# Altium project WIFI_BoardV4.00.PrjPcb (part 1 of 3)
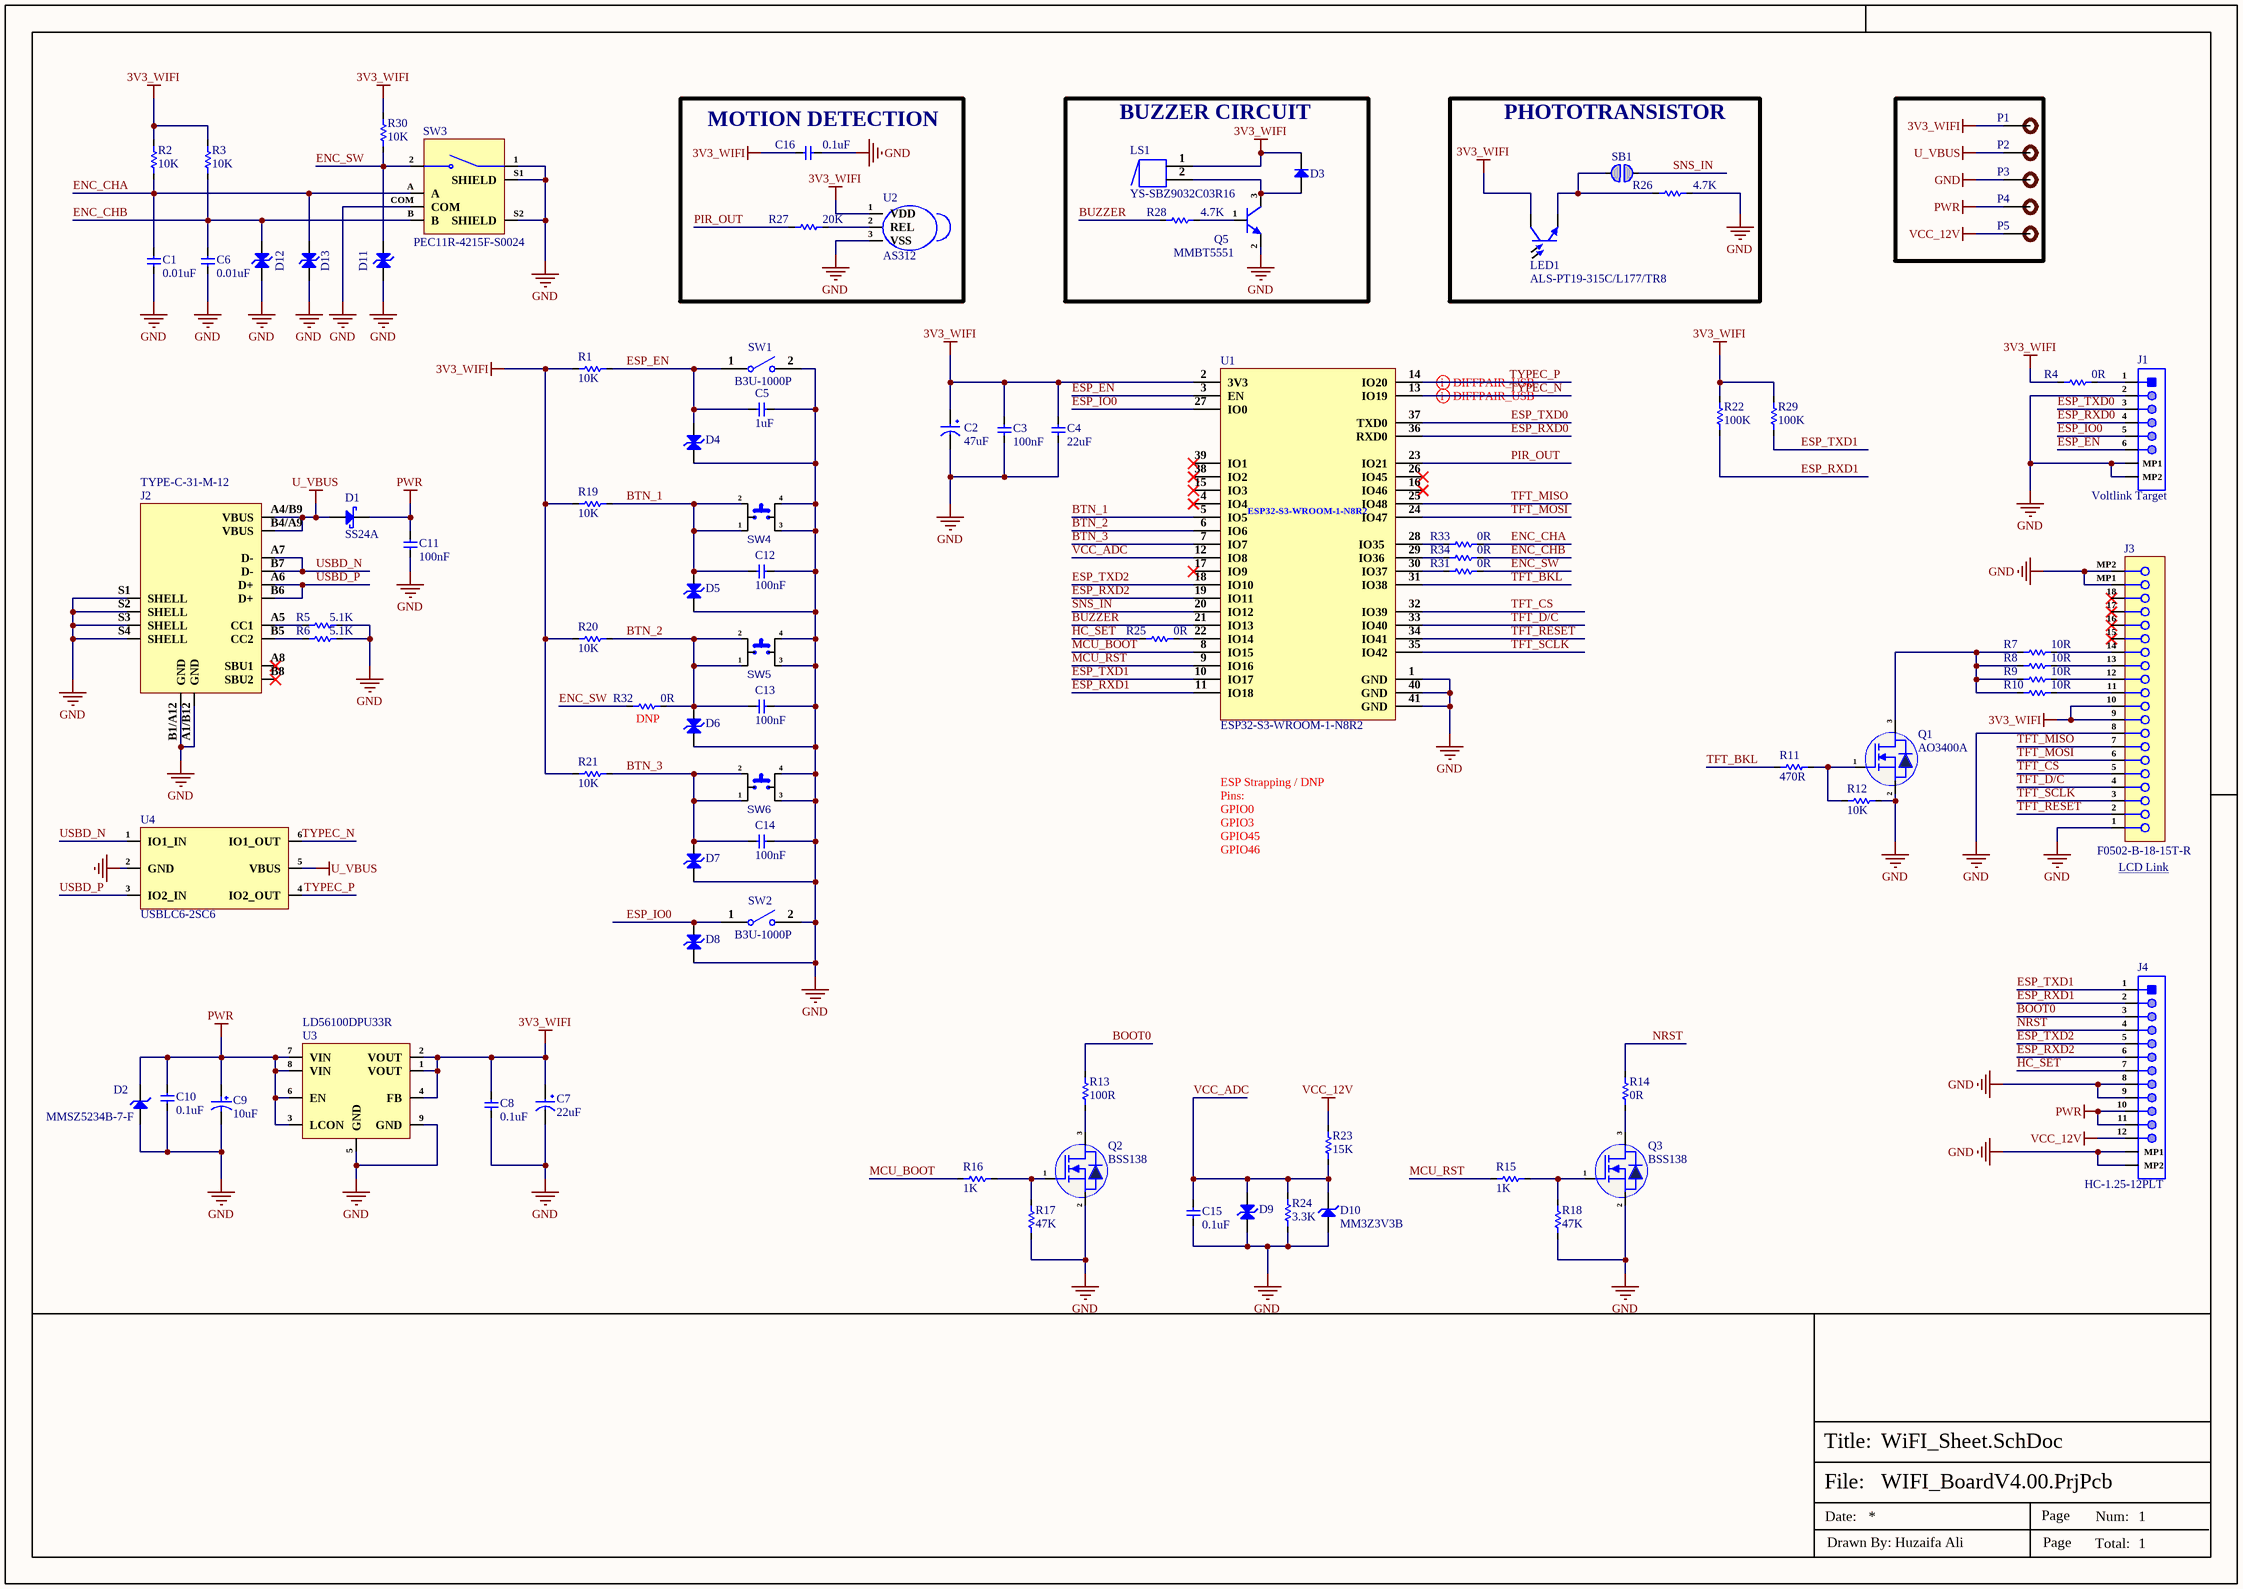
[diagram p0: WiFI_Sheet.SchDoc]
1 sheet, 89 parts. Net scope: global (net labels, ports and power ports of the same name join across sheets).
Board file: WIFI_BoardV4.00.PcbDoc

## Sheet WiFI_Sheet.SchDoc
size 420 x 297 mm; SheetNumber: 1; SheetTotal: 1

### Parts
C1  0.01uF  [Cap-0402]
C2  47uF  [Case-D]
C3  100nF  [Cap-0402]
C4  22uF  [Cap-0603]
C5  1uF  [Cap-0402]
C6  0.01uF  [Cap-0402]
C7  22uF  [Tant-0805]
C8  0.1uF  [Cap-0402]
C9  10uF  [Case-A]
C10  0.1uF  [Cap-0402]
C11  100nF  [Cap-0603]
C12  100nF  [Cap-0402]
C13  100nF  [Cap-0402]
C14  100nF  [Cap-0402]
C15  0.1uF  [Cap-0402]
C16  0.1uF  [Cap-0603]
D1  SS24A  [SMA]
D2  MMSZ5234B-7-F  [SOD-123]
D3  1N4148W-7-F  [SOD-123]  (value not drawn)
D4  LESD8D3.3CAT5G  [SOD-882 Bi Directional]  (value not drawn)
D5  LESD8D3.3CAT5G  [SOD-882 Bi Directional]  (value not drawn)
D6  LESD8D3.3CAT5G  [SOD-882 Bi Directional]  (value not drawn)
D7  LESD8D3.3CAT5G  [SOD-882 Bi Directional]  (value not drawn)
D8  LESD8D3.3CAT5G  [SOD-882 Bi Directional]  (value not drawn)
D9  LESD8D3.3CAT5G  [SOD-882 Bi Directional]  (value not drawn)
D10  MM3Z3V3B  [SOD323F]
D11  LESD8D3.3CAT5G  [SOD-882 Bi Directional]  (value not drawn)
D12  LESD8D3.3CAT5G  [SOD-882 Bi Directional]  (value not drawn)
D13  LESD8D3.3CAT5G  [SOD-882 Bi Directional]  (value not drawn)
J1  Voltlink Target  [Voltlink Target]
J2  TYPE-C-31-M-12  [TYPE-C-31-M-12_]
J3  F0502-B-18-15T-R  [F0502-B-18-15T-R]
J4  HC-1.25-12PLT  [HC-1.25-12PLT]
LED1  ALS-PT19-315C/L177/TR8  [ALS-PT19-315C/L177/TR_]
LS1  YS-SBZ9032C03R16  [YS-SBZ9032C03R16_]
P1  TEST POINT 0.5mm Dia  [Test-point - 0.5mm]  (value not drawn)
P2  TEST POINT 0.5mm Dia  [Test-point - 0.5mm]  (value not drawn)
P3  TEST POINT 0.5mm Dia  [Test-point - 0.5mm]  (value not drawn)
P4  TEST POINT 0.5mm Dia  [Test-point - 0.5mm]  (value not drawn)
P5  TEST POINT 0.5mm Dia  [Test-point - 0.5mm]  (value not drawn)
Q1  AO3400A  [sot-23]
Q2  BSS138  [Sot-23]
Q3  BSS138  [Sot-23]
Q5  MMBT5551  [SOT-23]
R1  10K  [Res-0402]
R2  10K  [Res-0603]
R3  10K  [Res-0603]
R4  0R  [Res-0603]
R5  5.1K  [Res-0603]
R6  5.1K  [Res-0603]
R7  10R  [Res-0402]
R8  10R  [Res-0402]
R9  10R  [Res-0402]
R10  10R  [Res-0402]
R11  470R  [Res-0603]
R12  10K  [Res-0603]
R13  100R  [Res-0402]
R14  0R  [Res-0402]
R15  1K  [Res-0402]
R16  1K  [Res-0402]
R17  47K  [Res-0402]
R18  47K  [Res-0402]
R19  10K  [Res-0402]
R20  10K  [Res-0402]
R21  10K  [Res-0402]
R22  100K  [Res-0603]
R23  15K  [Res-0603]
R24  3.3K  [Res-0603]
R25  0R  [Res-0603]
R26  4.7K  [Res-0603]
R27  20K  [Res-0603]
R28  4.7K  [Res-0603]
R29  100K  [Res-0603]
R30  10K  [Res-0603]
R31  0R  [Res-0603]
R32  DNP  [Res-0603]
R33  0R  [Res-0603]
R34  0R  [Res-0603]
SB1  Solder Bridge 0603  [Solder Bridge]  (value not drawn)  (no BOM)
SW1  B3U-1000P  [B3U-1000P]
SW2  B3U-1000P  [B3U-1000P]
SW3  PEC11R-4215F-S0024  [PEC11R-4215F-S0024]
SW4  TL3300CF160Q  [TL3300CF160Q.]  (value not drawn)
SW5  TL3300CF160Q  [TL3300CF160Q.]  (value not drawn)
SW6  TL3300CF160Q  [TL3300CF160Q.]  (value not drawn)
U1  ESP32-S3-WROOM-1-N8R2  [41-SMD Module]
U2  AS312  [AS312]
U3  LD56100DPU33R  [DFN-8(1.2x1.6)]
U4  USBLC6-2SC6  [SOT-23-6]

### Blocks framed on the sheet
MOTION DETECTION: C16 R27 U2
BUZZER CIRCUIT: D3 LS1 Q5 R28
PHOTOTRANSISTOR: LED1 R26 SB1

### Nets
3V3_WIFI: C2.1 C3.2 C4.2 C7.1 C8.2 C16.1 D3.2(K) J3.9 J3.10 LED1.1(C) LS1.1 P1.1 R1.2 R2.2 R3.1 R4.1 R19.2 R20.2 R21.2 R22.2 R29.2 R30.1 U1.2(3V3) U2.1(VDD) U3.1(VOUT) U3.2(VOUT) U3.4(FB)
GND: C1.1 C2.2 C3.1 C4.1 C5.1 C6.1 C7.2 C8.1 C9.2 C10.1 C11.1 C12.1 C13.1 C14.1 C15.1 C16.2 D2.1(A) D4.1(A) D5.1(A) D6.1(A) D7.1(A) D8.1(A) D9.1(A) D10.1(A) D11.1(A) D12.1(A) D13.1(A) J1.2 J1.MP1 J1.MP2 J2.A1/B12(GND) J2.B1/A12(GND) J2.S1(SHELL) J2.S2(SHELL) J2.S3(SHELL) J2.S4(SHELL) J3.1 J3.8 J3.MP1 J3.MP2 J4.8 J4.9 J4.MP1 J4.MP2 P3.1 Q1.2(S) Q2.2(S) Q3.2(S) Q5.2(E) R5.2 R6.2 R12.2 R17.1 R18.1 R24.1 R26.2 SW1.2 SW2.2 SW3.1 SW3.COM SW3.S1(SHIELD) SW3.S2(SHIELD) SW4.3 SW4.4 SW5.3 SW5.4 SW6.3 SW6.4 U1.1(GND) U1.40(GND) U1.41(GND) U2.3(VSS) U3.5(GND) U3.9(GND) U4.2(GND)
PWR: C9.1 C10.2 C11.2 D1.1(K) D2.2(K) J4.10 J4.11 P4.1 U3.3(LCON) U3.6(EN) U3.7(VIN) U3.8(VIN)
U_VBUS: D1.2(A) J2.A4/B9(VBUS) J2.B4/A9(VBUS) P2.1 U4.5(VBUS)
VCC_12V: J4.12 P5.1 R23.2
BOOT0: J4.3 R13.2
BTN_1: C12.2 D5.2(A) R19.1 SW4.1 SW4.2 U1.5(IO5)
BTN_2: C13.2 D6.2(A) R20.1 R32.2 SW5.1 SW5.2 U1.6(IO6)
BTN_3: C14.2 D7.2(A) R21.1 SW6.1 SW6.2 U1.7(IO7)
BUZZER: R28.1 U1.21(IO13)
ENC_CHA: C1.2 D13.2(A) R2.1 R33.2 SW3.A
ENC_CHB: C6.2 D12.2(A) R3.2 R34.2 SW3.B
ENC_SW: D11.2(A) R30.2 R31.2 R32.1 SW3.2
ESP_EN: C5.2 D4.2(A) J1.6 R1.1 SW1.1 U1.3(EN)
ESP_IO0: D8.2(A) J1.5 SW2.1 U1.27(IO0)
ESP_RXD0: J1.4 U1.36(RXD0)
ESP_RXD1: J4.2 R22.1 U1.11(IO18)
ESP_RXD2: J4.6 U1.19(IO11)
ESP_TXD0: J1.3 U1.37(TXD0)
ESP_TXD1: J4.1 R29.1 U1.10(IO17)
ESP_TXD2: J4.5 U1.18(IO10)
HC_SET: J4.7 R25.1
MCU_BOOT: R16.2 U1.8(IO15)
MCU_RST: R15.2 U1.9(IO16)
NRST: J4.4 R14.2
PIR_OUT: R27.1 U1.23(IO21)
SNS_IN: SB1.1 U1.20(IO12)
TFT_BKL: R11.1 U1.31(IO38)
TFT_CS: J3.5 U1.32(IO39)
TFT_D/C: J3.4 U1.33(IO40)
TFT_MISO: J3.7 U1.25(IO48)
TFT_MOSI: J3.6 U1.24(IO47)
TFT_RESET: J3.2 U1.34(IO41)
TFT_SCLK: J3.3 U1.35(IO42)
TYPEC_N: U1.13(IO19) U4.6(IO1_OUT)
TYPEC_P: U1.14(IO20) U4.4(IO2_OUT)
USBD_N: J2.A7(D-) J2.B7(D-) U4.1(IO1_IN)
USBD_P: J2.A6(D+) J2.B6(D+) U4.3(IO2_IN)
VCC_ADC: C15.2 D9.2(A) D10.2(K) R23.1 R24.2 U1.12(IO8)
NetD3_1: D3.1(A) LS1.2 Q5.3(C)
NetJ1_1: J1.1 R4.2
NetJ2_A5: J2.A5(CC1) R5.1
NetJ2_B5: J2.B5(CC2) R6.1
NetJ3_11: J3.11 R10.2
NetJ3_12: J3.12 R9.2
NetJ3_13: J3.13 R8.2
NetJ3_14: J3.14 R7.2
NetLED1_2: LED1.2(E) R26.1 SB1.2
NetQ1_1: Q1.1(G) R11.2 R12.1
NetQ1_3: Q1.3(D) R7.1 R8.1 R9.1 R10.1
NetQ2_1: Q2.1(G) R16.1 R17.2
NetQ2_3: Q2.3(D) R13.1
NetQ3_1: Q3.1(G) R15.1 R18.2
NetQ3_3: Q3.3(D) R14.1
NetQ5_1: Q5.1(B) R28.2
NetR25_2: R25.2 U1.22(IO14)
NetR27_2: R27.2 U2.2(REL)
NetR31_1: R31.1 U1.30(IO37)
NetR33_1: R33.1 U1.28(IO35)
NetR34_1: R34.1 U1.29(IO36)

Not connected (* = marked no-connect by the designer): J2 A8(SBU1)* B8(SBU2)*; J3 15* 16* 17* 18*; U1 4(IO4)* 15(IO3)* 16(IO46)* 17(IO9)* 26(IO45)* 38(IO2)* 39(IO1)*

### Layout directives
differential pair; net class USB_PROG; differential pair class USB_PROG_LINES: TYPEC_N, TYPEC_P

### Notes on the sheet
- (near R32) 0R
- ESP Strapping / DNP Pins:
  GPIO0
  GPIO3
  GPIO45
  GPIO46
- (near J3) LCD Link <https://www.eya-display.com/ht240s030/>
- File:
- Title:
- Date:
- Page
- Num:
- Total:
- Drawn By: Huzaifa Ali